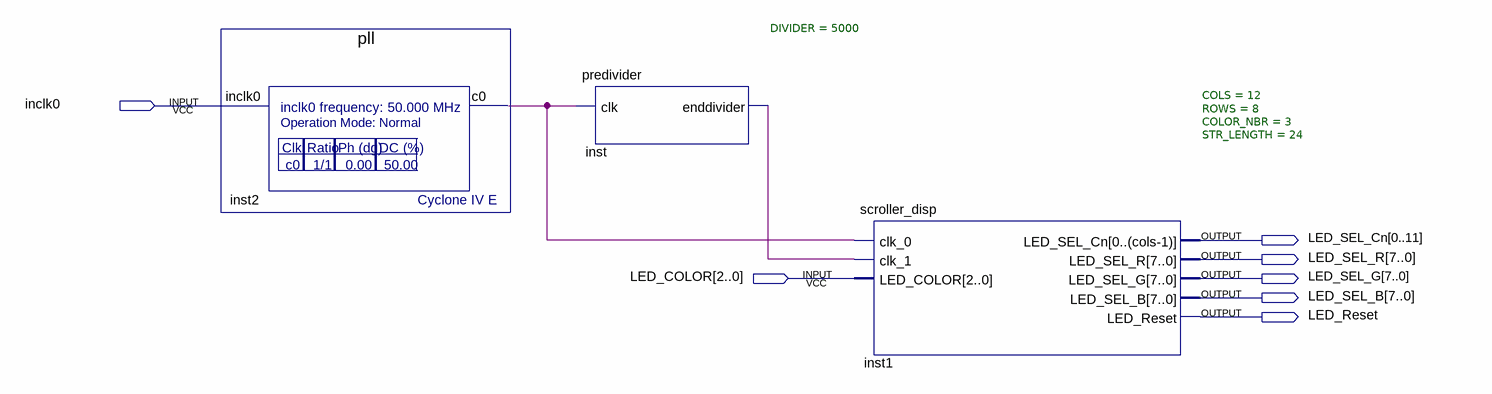
[diagram p0: schematic sheet]
// Quartus schematic Lab.bdf as structural Verilog: 3 symbols, 7 pins
module Lab (
  input  inclk0,
  input  [2:0] LED_COLOR,
  output [0:11] LED_SEL_Cn,
  output [7:0] LED_SEL_R,
  output [7:0] LED_SEL_G,
  output [7:0] LED_SEL_B,
  output LED_Reset
);

  wire inst2_c0, inst_enddivider;

  pll inst2 (.inclk0(inclk0), .c0(inst2_c0));
  predivider #(.DIVIDER(5000)) inst (.clk(inst2_c0), .enddivider(inst_enddivider));
  scroller_disp #(.COLS(12), .ROWS(8), .COLOR_NBR(3), .STR_LENGTH(24)) inst1 (
    .clk_0(inst2_c0), .clk_1(inst_enddivider), .LED_COLOR(LED_COLOR), .LED_SEL_Cn(LED_SEL_Cn),
    .LED_SEL_R(LED_SEL_R), .LED_SEL_G(LED_SEL_G), .LED_SEL_B(LED_SEL_B), .LED_Reset(LED_Reset));
endmodule
